# Altium schematic sheet Current_Sense_Section.SchDoc: =Projectname
size A4; SheetNumber: 4; SheetTotal: 7
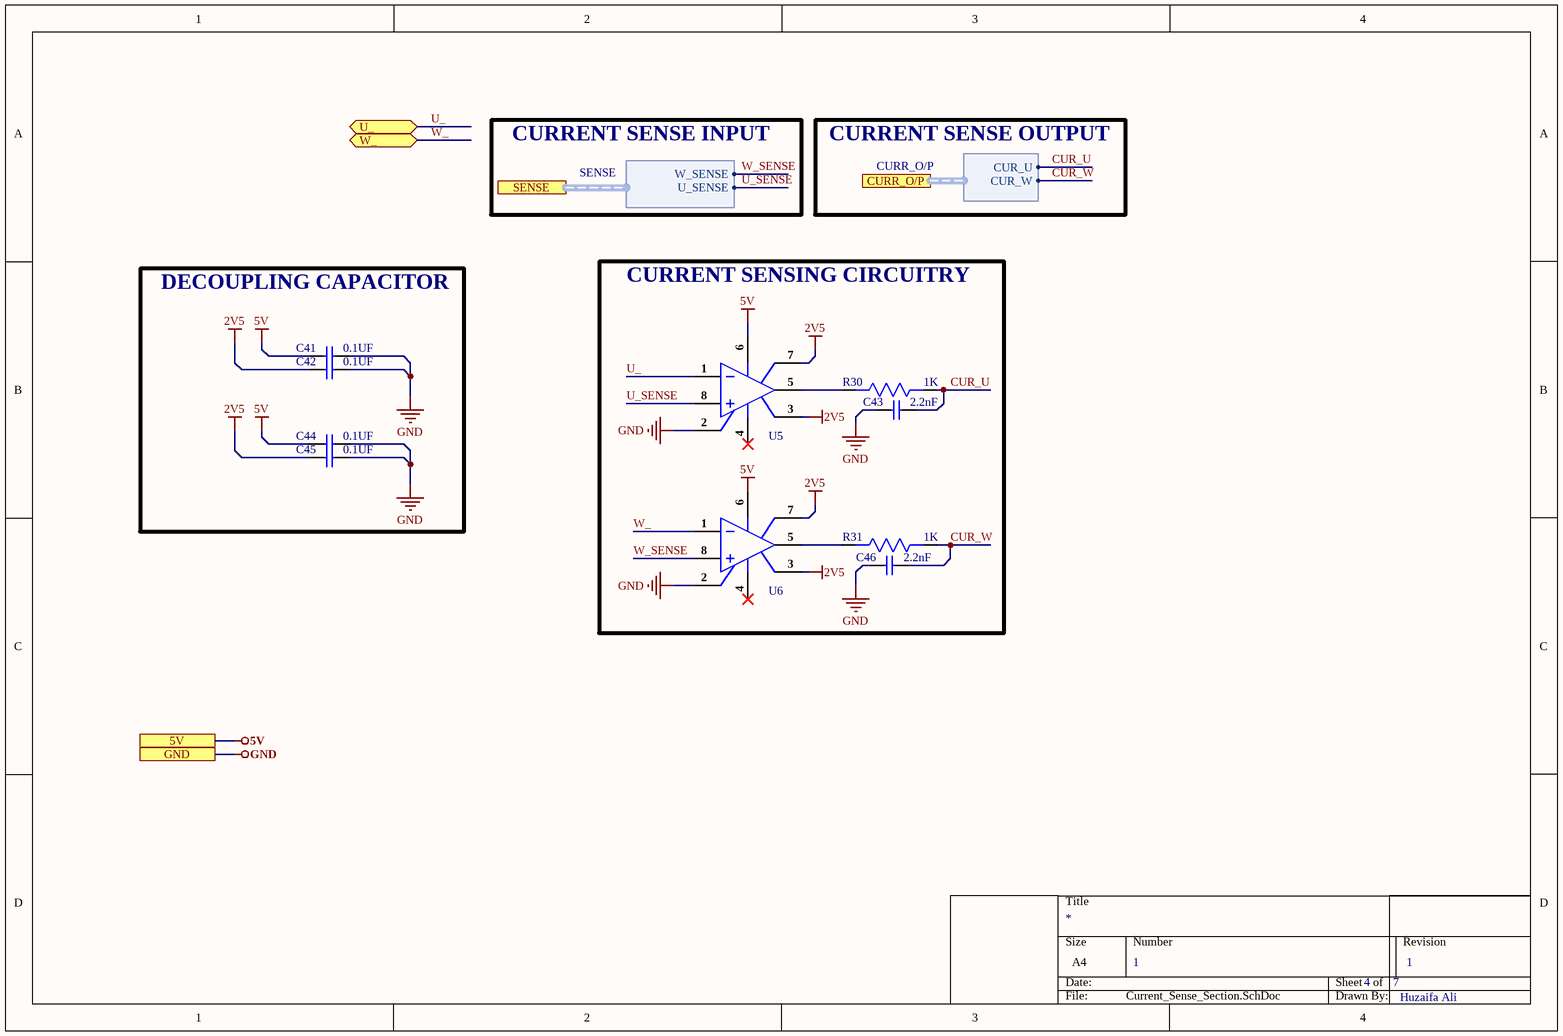
[diagram p0: Current_Sense_Section.SchDoc]

## Parts
C41  0.1UF  [Cap0402]
C42  0.1UF  [Cap0402]
C43  2.2nF  [Cap0603]
C44  0.1UF  [Cap0402]
C45  0.1UF  [Cap0402]
C46  2.2nF  [Cap0603]
R30  1K  [Res0603]
R31  1K  [Res0603]
U5  AD8418WBRZ-RL  [SOIC-8]  (value not drawn)
U6  AD8418WBRZ-RL  [SOIC-8]  (value not drawn)

## Blocks framed on the sheet
DECOUPLING CAPACITOR: C41 C42 C44 C45
CURRENT SENSING CIRCUITRY: C43 C46 R30 R31 U5 U6

## Ports
5V, CURR_O/P (harness CURR_O/P), GND, SENSE (harness SENSE), U_ (bidir), W_ (bidir)

## Harnesses
CURR_O/P: CUR_U, CUR_W
SENSE: W_SENSE, U_SENSE

## Nets
2V5: C42.1 C45.1 U5.3(VREF2) U5.7(VREF1) U6.3(VREF2) U6.7(VREF1)
5V: C41.1 C44.1 U5.6(VS) U6.6(VS) ; port 5V
GND: C41.2 C42.2 C43.1 C44.2 C45.2 C46.1 U5.2(GND) U6.2(GND) ; port GND
CUR_U: C43.2 R30.1 ; port CURR_O/P.CUR_U
CUR_W: C46.2 R31.1 ; port CURR_O/P.CUR_W
U_: U5.1(IN-) ; port U_
U_SENSE: U5.8(IN+) ; port SENSE.U_SENSE
W_: U6.1(IN-) ; port W_
W_SENSE: U6.8(IN+) ; port SENSE.W_SENSE
NetR30_2: R30.2 U5.5(OUT)
NetR31_2: R31.2 U6.5(OUT)

Not connected (* = marked no-connect by the designer): U5 4(NC)*; U6 4(NC)*

## Notes on the sheet
- CURRENT SENSE INPUT
- CURRENT SENSE OUTPUT
- 1
- Huzaifa Ali

## Library data of the parts
C41 C42 C44 C45 = CL05B104KB54PNC: CAP CER 0.1UF 50V X7R 0402; Manufacturer: Samsung; Supplier 1: Digi-Key; Manufacturer Part Number: CL05B104KB54PNC; Stock 1: 8594; Pricing 1: 1=0.1, 10=0.067, 50=0.0366, 100=0.0299, 500=0.02138, 1000=0.01681, 2500=0.01528, 5000=0.01406 (USD); Supplier Part Number 1: 1276-CL05B104KB54PNCDKR-ND
C43 C46 = CC0603KRX7R9BB222: CAP CER 2200PF 50V X7R 0603; Manufacturer: Yageo; Tolerance: 10%; Insulation Resistance: 10GR; Dissipation Factor: 2.5%; Supplier 1: Arrow Electronics; Manufacturer Part Number: CC0603KRX7R9BB222; RoHS: Yes; Category: Ceramic Capacitors; Stock 1: 84000; Pricing 1: 4000=0.01010, 8000=0.00890, 12000=0.00830, 40000=0.00750 (USD); Mount: Surface Mount; Case/Package: 0603; Number of Pins: 2; Case Code (Metric): 1608; Case Code (Imperial): 0603; Min Operating Temperature: -55°C; Max Operating Temperature: 125°C; Capacitance: 2.2nF; Dielectric: X7R; Package Quantity: 1; Voltage Rating: 50V; Packaging: Tape and Reel; Voltage Rating (DC): 50V; Termination: SMD/SMT; Resistor Type: Ceramic; Voltage: 50V; Series: CC; Length: 1.6mm; Width: 0.031inch; Height: 0.8mm; Thickness: 0.035inch; Depth: 0.8mm; Radiation Hardening: No; REACH SVHC: No SVHC; Lead Free: Lead Free; Halogen Free: Halogen Free; RoHS Compliant: Yes; ComponentLink1URL: https://datasheet.ciiva.com/23768/1079489-23768004.pdf?src-supplier=Newark; ComponentLink1Description: https://datasheet.ciiva.com/23768/1079489-23768004.pdf?src-supplier=Newark; ComponentLink2URL: https://datasheet.ciiva.com/11788/0900766b8079c870-11788403.pdf?src-supplier=RSComponents; ComponentLink2Description: https://datasheet.ciiva.com/11788/0900766b8079c870-11788403.pdf?src-supplier=RSComponents; ComponentLink3URL: https://datasheet.ciiva.com/26862/getdatasheetpartid-403587-26862854.pdf?src-supplier=Verical; ComponentLink3Description: https://datasheet.ciiva.com/26862/getdatasheetpartid-403587-26862854.pdf?src-supplier=Verical; ComponentLink4URL: https://datasheet.ciiva.com/8033/70765-8033863.pdf?src-supplier=Element14; ComponentLink4Description: https://datasheet.ciiva.com/8033/70765-8033863.pdf?src-supplier=Element14; ComponentLink5URL: https://datasheet.ciiva.com/7978/1489800-7978172.pdf?src-supplier=Element14; ComponentLink5Description: https://datasheet.ciiva.com/7978/1489800-7978172.pdf?src-supplier=Element14; ComponentLink6URL: https://datasheet.ciiva.com/28450/1489800-28450632.pdf?src-supplier=Element14; ComponentLink6Description: https://datasheet.ciiva.com/28450/1489800-28450632.pdf?src-supplier=Element14; ComponentLink7URL: https://datasheet.ciiva.com/155/mlccorderingcode-155921.pdf?src-supplier=Digi-Key; ComponentLink7Description: https://datasheet.ciiva.com/155/mlccorderingcode-155921.pdf?src-supplier=Digi-Key; ComponentLink8URL: https://datasheet.ciiva.com/155/mlccorderingcode-155920.pdf?src-supplier=Digi-Key; ComponentLink8Description: https://datasheet.ciiva.com/155/mlccorderingcode-155920.pdf?src-supplier=Digi-Key; ComponentLink9URL: https://datasheet.ciiva.com/155/mlccorderingcode-155922.pdf?src-supplier=Digi-Key; ComponentLink9Description: https://datasheet.ciiva.com/155/mlccorderingcode-155922.pdf?src-supplier=Digi-Key; ComponentLink10URL: https://datasheet.ciiva.com/8033/1489800-8033864.pdf?src-supplier=Element14; ComponentLink10Description: https://datasheet.ciiva.com/8033/1489800-8033864.pdf?src-supplier=Element14; ComponentLink11URL: https://datasheet.ciiva.com/8033/1489800-8033862.pdf?src-supplier=Element14; ComponentLink11Description: https://datasheet.ciiva.com/8033/1489800-8033862.pdf?src-supplier=Element14; Supplier Part Number 1: CC0603KRX7R9BB222
R30 R31 = RC0603FR-071KL: RES SMD 1K OHM 1% 1/10W 0603; Manufacturer: Yageo; Resistance: 1kR; Temperature Coefficient: 100ppm/°C; Power Rating: 100mW; Voltage Rating: 50V; ComponentLink1URL: https://www.verical.com/server-webapp/html/getDatasheet?partID=409289&src-supplier=Verical; ComponentLink1Description: https://www.verical.com/server-webapp/html/getDatasheet?partID=409289&src-supplier=Verical; Supplier 1: Digi-Key; Manufacturer Part Number: RC0603FR-071KL; Stock 1: 21472395; Pricing 1: 1=0.1, 10=0.023, 100=0.0094, 1000=0.0042, 2500=0.0037 (USD); Case/Package: 0603; Contact Plating: Tin,Matte; Case Code (Imperial): 0603; Case Code (Metric): 1608; Min Operating Temperature: -55°C; Max Operating Temperature: 155°C; Tolerance: 1%; Composition: Thick Film; Packaging: Tape and Reel; Termination: SMD/SMT; Military Standard: Not; Length: 1.6mm; Height: 0.45mm; Depth: 0.8mm; Radiation Hardening: No; REACH SVHC: No SVHC; Lead Free: Lead Free; ComponentLink2URL: http://documents.rs-components.com/techlib://itc_doclist_GB.htm?stockno=5048928&src-supplier=RSComponents; ComponentLink2Description: http://documents.rs-components.com/techlib://itc_doclist_GB.htm?stockno=5048928&src-supplier=RSComponents; ComponentLink3URL: http://www.yageo.com/documents/recent/PYu-RC0603_51_RoHS_L_4.pdf?src-supplier=Avnet+Europe; ComponentLink3Description: http://www.yageo.com/documents/recent/PYu-RC0603_51_RoHS_L_4.pdf?src-supplier=Avnet+Europe; ComponentLink4URL: http://www.farnell.com/datasheets/2167052.pdf?src-supplier=Element14; ComponentLink4Description: http://www.farnell.com/datasheets/2167052.pdf?src-supplier=Element14; ComponentLink5URL: http://www.farnell.com/datasheets/1868787.pdf?src-supplier=Element14; ComponentLink5Description: http://www.farnell.com/datasheets/1868787.pdf?src-supplier=Element14; ComponentLink6URL: http://www.yageo.com/documents/recent/PYu-RC_Group_51_RoHS_L_2.pdf?src-supplier=Avnet; ComponentLink6Description: http://www.yageo.com/documents/recent/PYu-RC_Group_51_RoHS_L_2.pdf?src-supplier=Avnet; ComponentLink7URL: https://www.verical.com/server-webapp/html/getDatasheet?partID=404327&src-supplier=Verical; ComponentLink7Description: https://www.verical.com/server-webapp/html/getDatasheet?partID=404327&src-supplier=Verical; ComponentLink8URL: http://www.farnell.com/datasheets/443971.pdf?src-supplier=Element14; ComponentLink8Description: http://www.farnell.com/datasheets/443971.pdf?src-supplier=Element14; Supplier Part Number 1: 311-1.00KHRDKR-ND
U5 U6 = AD8418WBRZ-RL: IC CURRENT SENSE 1 CIRCUIT 8SOIC; Manufacturer: Analog Devices; Input Capacitance: 2pF; Common Mode Rejection Ratio: 90dB; Min Supply Voltage: 2.7V; Max Supply Voltage: 5.5V; Min Dual Supply Voltage: 1.35V; Max Dual Supply Voltage: 2.75V; Number of Circuits: 1; Slew Rate: 1V/µs; -3db Bandwidth: 250kHz; Input Offset Voltage (Vos): 200uV; Operating Supply Current: 2.6mA; Power Supply Rejection Ratio (PSRR): 80dB; Supplier 1: Mouser; Manufacturer Part Number: AD8418WBRZ-RL; RoHS: Yes; Category: Power Management ICs; Pricing 1: 1=3.18000, 10=2.86000, 25=2.70000, 50=2.70000, 100=2.34000, 250=2.22000, 500=1.99000, 1000=1.70000, 2500=1.69000, 10000=1.69000 (USD); Mount: Surface Mount; Case/Package: SOIC; Number of Pins: 8; Contact Plating: Tin,Matte; Min Operating Temperature: -40°C; Max Operating Temperature: 125°C; Packaging: Tape and Reel; Lead Free: Contains Lead; ComponentLink1URL: https://datasheet.ciiva.com/30008/ad8418-30008109.pdf?src-supplier=Avnet; ComponentLink1Description: https://datasheet.ciiva.com/30008/ad8418-30008109.pdf?src-supplier=Avnet; Supplier Part Number 1: 584-AD8418WBRZ-RL